# Altium schematic sheet Current_Sense_Section.SchDoc
size A4; DocumentNumber: 3; SheetNumber: 3; SheetTotal: 7
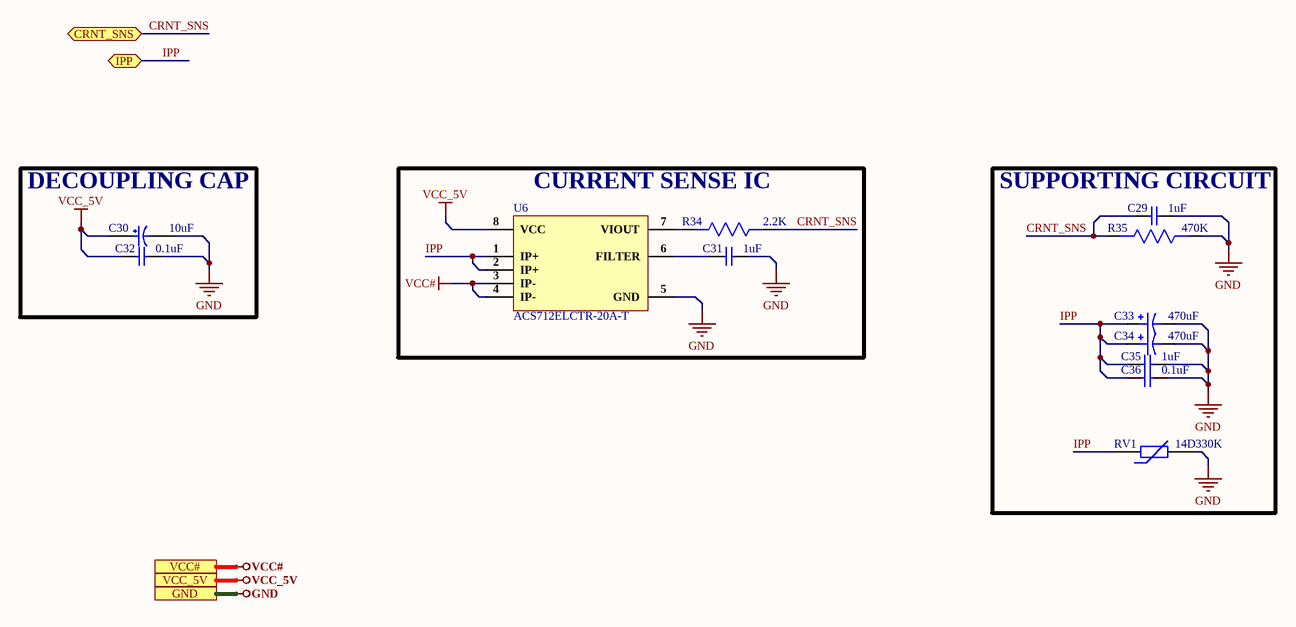
[diagram p0: Current_Sense_Section.SchDoc]

## Parts
C29  1uF  [Cap0603]
C30  10uF  [RVT1E100M0405.]
C31  1uF  [Cap0603]
C32  0.1uF  [Cap0603]
C33  470uF  [VT1H471MI135000CE0]
C34  470uF  [VT1H471MI135000CE0]
C35  1uF  [Cap0603]
C36  0.1uF  [Cap0603]
R34  2.2K  [Res0603]
R35  470K  [Res0603]
RV1  14D330K  [14D330K]
U6  ACS712ELCTR-20A-T  [SOIC-8]

## Blocks framed on the sheet
DECOUPLING CAP: C30 C32
CURRENT SENSE IC: C31 R34 U6
SUPPORTING CIRCUIT: C29 C33-C36 R35 RV1

## Ports
CRNT_SNS (bidir), GND, IPP (bidir), VCC#, VCC_5V

## Nets
GND: C29.2 C30.2 C31.2 C32.2 C33.2 C34.2 C35.2 C36.2 R35.1 RV1.2 U6.5(GND) ; port GND
VCC#: U6.3(IP-) U6.4(IP-) ; port VCC#
VCC_5V: C30.1 C32.1 U6.8(VCC) ; port VCC_5V
CRNT_SNS: C29.1 R34.1 R35.2 ; port CRNT_SNS
IPP: C33.1 C34.1 C35.1 C36.1 RV1.1 U6.1(IP+) U6.2(IP+) ; port IPP
NetC31_1: C31.1 U6.6(FILTER)
NetR34_2: R34.2 U6.7(VIOUT)

## Notes on the sheet
- 1
- Huzaifa Ali

## Library data of the parts
C29 C31 C35 = CL10A105KA8NNNC: CAP CER 1UF 25V X5R 0603; Manufacturer: Sams; Tolerance: 10%; Supplier 1: Digi-Key; Manufacturer Part Number: CL10A105KA8NNNC; Stock 1: 2768758; Pricing 1: 1=0.1, 10=0.036, 50=0.0198, 100=0.0161, 500=0.01152, 1000=0.00904 (USD); Mount: Surface Mount; Case/Package: 0603; Min Operating Temperature: -55°C; Max Operating Temperature: 85°C; Capacitance: 1uF; Dielectric: X5R; Voltage Rating (DC): 25V; Voltage: 25V; Length: 1.6mm; Height: 0.8mm; Depth: 0.8mm; Lead Free: Lead Free; Supplier Part Number 1: 1276-1102-1-ND
C30 = RVT1E100M0405: CAP ALUM 10uF 25V SMD; Manufacturer: ROQANG; φD: 4mm; L: 5.4mm; Tolerance: ±20%; Operating Temperature: -45℃~+105℃; Rated Voltage: 25V; Capacitance: 10uF
C32 C36 = CC0603KRX7R0BB104: CAP CER 0.1UF 100V X7R 0603; Manufacturer: Yageo; Capacitance: 100nF; Tolerance: 10%; Supplier 1: Digi-Key; Manufacturer Part Number: CC0603KRX7R0BB104; RoHS: Yes; Category: Ceramic Capacitors; Stock 1: 60476; Pricing 1: 1=0.19000, 10=0.13500, 50=0.07680, 100=0.06370, 500=0.04466, 1000=0.03696 (USD); Mount: Surface Mount; Case/Package: 0603; Case Code (Metric): 1608; Case Code (Imperial): 0603; Weight: 7.1E-05oz; Min Operating Temperature: -55°C; Max Operating Temperature: 125°C; Package Quantity: 4000; Voltage Rating: 100V; Packaging: Tape and Reel; Dielectric: X7R; Termination: SMD/SMT; Resistor Type: Ceramic; Voltage Rating (DC): 100V; Series: CC; Length: 0.063inch; Width: 0.031inch; Thickness: 0.035inch; Depth: 0.8mm; Lead Free: Lead Free; RoHS Compliant: Yes; ComponentLink1URL: https://datasheet.ciiva.com/6277/mlccorderingcode-6277030.pdf?src-supplier=Digi-Key; ComponentLink1Description: https://datasheet.ciiva.com/6277/mlccorderingcode-6277030.pdf?src-supplier=Digi-Key; ComponentLink2URL: https://datasheet.ciiva.com/6277/mlccorderingcode-6277081.pdf?src-supplier=Digi-Key; ComponentLink2Description: https://datasheet.ciiva.com/6277/mlccorderingcode-6277081.pdf?src-supplier=Digi-Key; ComponentLink3URL: https://datasheet.ciiva.com/6277/mlccorderingcode-6277082.pdf?src-supplier=Digi-Key; ComponentLink3Description: https://datasheet.ciiva.com/6277/mlccorderingcode-6277082.pdf?src-supplier=Digi-Key; Supplier Part Number 1: 311-1523-1-ND
C33 C34 = VT1H471MI135000CE0: 470uF ±20% 50V 12.5mm 13.5mm 1000hrs 105℃ -40℃~+105℃ SMD,12.5x13.5mm Aluminum Electrolytic Capacitors - SMD RoHS; Manufacturer: Changzhou Huawei Elec; Package: SMD,12.5x13.5mm; Capacitance: 470uF; Tolerance: ±20%; Rated Voltage: 50V; φD: 12.5mm; L: 13.5mm; Lifetime @ Temp: 1000hrs 105℃; Operating Temperature: -40℃~+105℃
R34 = RC0603FR-072K2L: RES SMD 2.2K OHM 1% 1/10W 0603; Manufacturer: Yageo Phycomp; Temperature Coefficient: 100ppm/°C; Resistance: 2.2kR; Power Rating: 100mW; Voltage Rating (DC): 50V; Supplier 1: Digi-Key; Manufacturer Part Number: RC0603FR-072K2L; Stock 1: 10587920; Pricing 1: 1=0.1, 10=0.023, 100=0.0094, 1000=0.00421, 2500=0.00366 (USD); Mount: Surface Mount; Case/Package: 0603; Number of Pins: 2; Min Operating Temperature: -55°C; Max Operating Temperature: 155°C; Tolerance: 1%; Packaging: Cut Tape; Length: 1.6mm; Height: 0.45mm; Width: 800um; Depth: 0.8mm; REACH SVHC: No SVHC; Lead Free: Lead Free; Supplier Part Number 1: 311-2.20KHRCT-ND
R35 = AC0603JR-07470KL: RES SMD 470K OHM 5% 1/10W 0603; Manufacturer: Yageo; Resistance: 470kR; Power Rating: 100mW; Voltage Rating: 50V; Temperature Coefficient: 100ppm/°C; ComponentLink1URL: https://datasheet.ciiva.com/11820/0900766b80808d64-11820639.pdf?src-supplier=RSComponents; ComponentLink1Description: https://datasheet.ciiva.com/11820/0900766b80808d64-11820639.pdf?src-supplier=RSComponents; ComponentLink2URL: https://datasheet.ciiva.com/2487/rr-data-sheet-2487286.pdf?src-supplier=Digi-Key; ComponentLink2Description: https://datasheet.ciiva.com/2487/rr-data-sheet-2487286.pdf?src-supplier=Digi-Key; ComponentLink3URL: https://datasheet.ciiva.com/7984/87330-7984374.pdf?src-supplier=Element14; ComponentLink3Description: https://datasheet.ciiva.com/7984/87330-7984374.pdf?src-supplier=Element14; ComponentLink4URL: https://datasheet.ciiva.com/2487/rr-data-sheet-2487287.pdf?src-supplier=Digi-Key; ComponentLink4Description: https://datasheet.ciiva.com/2487/rr-data-sheet-2487287.pdf?src-supplier=Digi-Key; ComponentLink5URL: https://datasheet.ciiva.com/2487/rr-data-sheet-2487288.pdf?src-supplier=Digi-Key; ComponentLink5Description: https://datasheet.ciiva.com/2487/rr-data-sheet-2487288.pdf?src-supplier=Digi-Key; ComponentLink6URL: https://datasheet.ciiva.com/5759/87330-5759049.pdf?src-supplier=Farnell; ComponentLink6Description: https://datasheet.ciiva.com/5759/87330-5759049.pdf?src-supplier=Farnell; Supplier 1: Digi-Key; Manufacturer Part Number: AC0603JR-07470KL; Stock 1: 71; Pricing 1: 1=0.1, 10=0.024, 100=0.0097, 1000=0.0044, 2500=0.0038 (USD); Case/Package: 0603; Case Code (Imperial): 0603; Case Code (Metric): 1608; Weight: 7.1E-05oz; Min Operating Temperature: -55°C; Max Operating Temperature: 155°C; Tolerance: 5%; Packaging: Tape and Reel; Resistor Type: Thick Film; Termination: SMD/SMT; Number of Terminations: 2; Max Power Dissipation: 100mW; Features: Moisture Resistant,Automotive AEC-Q200; Series: AC; Length: 0.063inch; Width: 0.8mm; Height: 0.022inch; RoHS Compliant: Yes; ComponentLink7URL: http://www.mouser.com/ds/2/447/yageodocoutput-1111992.pdf?src-supplier=Mouser; ComponentLink7Description: http://www.mouser.com/ds/2/447/yageodocoutput-1111992.pdf?src-supplier=Mouser; Supplier Part Number 1: YAG3672DKR-ND
RV1 = 14D330K: 65V 5.9J 8500pF@1kHz 26V 20V 30V~36V 1kA Radial Leaded Varistors ROHS; Manufacturer: Hongzhi Elec; Manufacturer Part Number: 14D330K; Footprint: Radial; ComponentLink1Description: LCSC; ComponentLink1URL: https://lcsc.com/product-detail/Varistors_Hongzhi-Elec-14D330K_C137829.html
U6 = ACS712ELCTR-20A-T: SENSOR CURRENT HALL 20A AC/DC; Manufacturer: Allegro MicroSystems; Operating Supply Voltage: 5V; Output Current: 10mA; Max Supply Current: 13mA; Min Supply Voltage: 4.5V; Max Supply Voltage: 5.5V; Bandwidth: 80kHz; Number of Channels: 1; Response Time: 5us; Polarity: Bidirectional; Accuracy: 1.5%; Sensitivity: 100mV/A; Supplier 1: RSComponents; Manufacturer Part Number: ACS712ELCTR-20A-T; RoHS: Yes; Category: Magnetic Sensors; Stock 1: 93; Pricing 1: 1=6.70000, 25=4.23000, 100=3.64000, 250=3.35000, 500=3.04000 (GBP); Case/Package: SOIC; Number of Pins: 8; Min Operating Temperature: -40°C; Max Operating Temperature: 85°C; Package Quantity: 1; Frequency: 80kHz; Packaging: Tape and Reel; Termination: SMD/SMT; Quiescent Current: 10mA; Linearity: 1.5%; Current Sensing: 20A; Series: -; Length: 4.9mm; Width: 3.9mm; Height: 1.5mm; Radiation Hardening: No; REACH SVHC: No SVHC; Lead Free: Lead Free; RoHS Compliant: Yes; ComponentLink1URL: https://datasheet.ciiva.com/15099/getdatasheetpartid-312820-15099471.pdf?src-supplier=Verical; ComponentLink1Description: https://datasheet.ciiva.com/15099/getdatasheetpartid-312820-15099471.pdf?src-supplier=Verical; ComponentLink2URL: https://datasheet.ciiva.com/1165/64754-1165093.pdf?src-supplier=Element14; ComponentLink2Description: https://datasheet.ciiva.com/1165/64754-1165093.pdf?src-supplier=Element14; ComponentLink3URL: https://datasheet.ciiva.com/3272/acs712-datasheet-3272423.pdf?src-supplier=Avnet; ComponentLink3Description: https://datasheet.ciiva.com/3272/acs712-datasheet-3272423.pdf?src-supplier=Avnet; ComponentLink4URL: https://datasheet.ciiva.com/3271/acs712-datasheet-3271995.pdf?src-supplier=Avnet; ComponentLink4Description: https://datasheet.ciiva.com/3271/acs712-datasheet-3271995.pdf?src-supplier=Avnet; ComponentLink5URL: https://datasheet.ciiva.com/16636/acs712-datasheet-16636599.pdf?; ComponentLink5Description: https://datasheet.ciiva.com/16636/acs712-datasheet-16636599.pdf?; Supplier Part Number 1: 6807135